# EasyEDA Pro project curtain-lifter.epro, schematic Schematic1
Board Name: Board1; Create Date: 2026-07-17; Page Name: P1; Project Name: 涂鸦智能家居产品-窗帘开关; Schematic Name: Schematic1; Update Date: 2026-07-17; Company: 嘉立创EDA; Page Size: A4; Version: V1.0
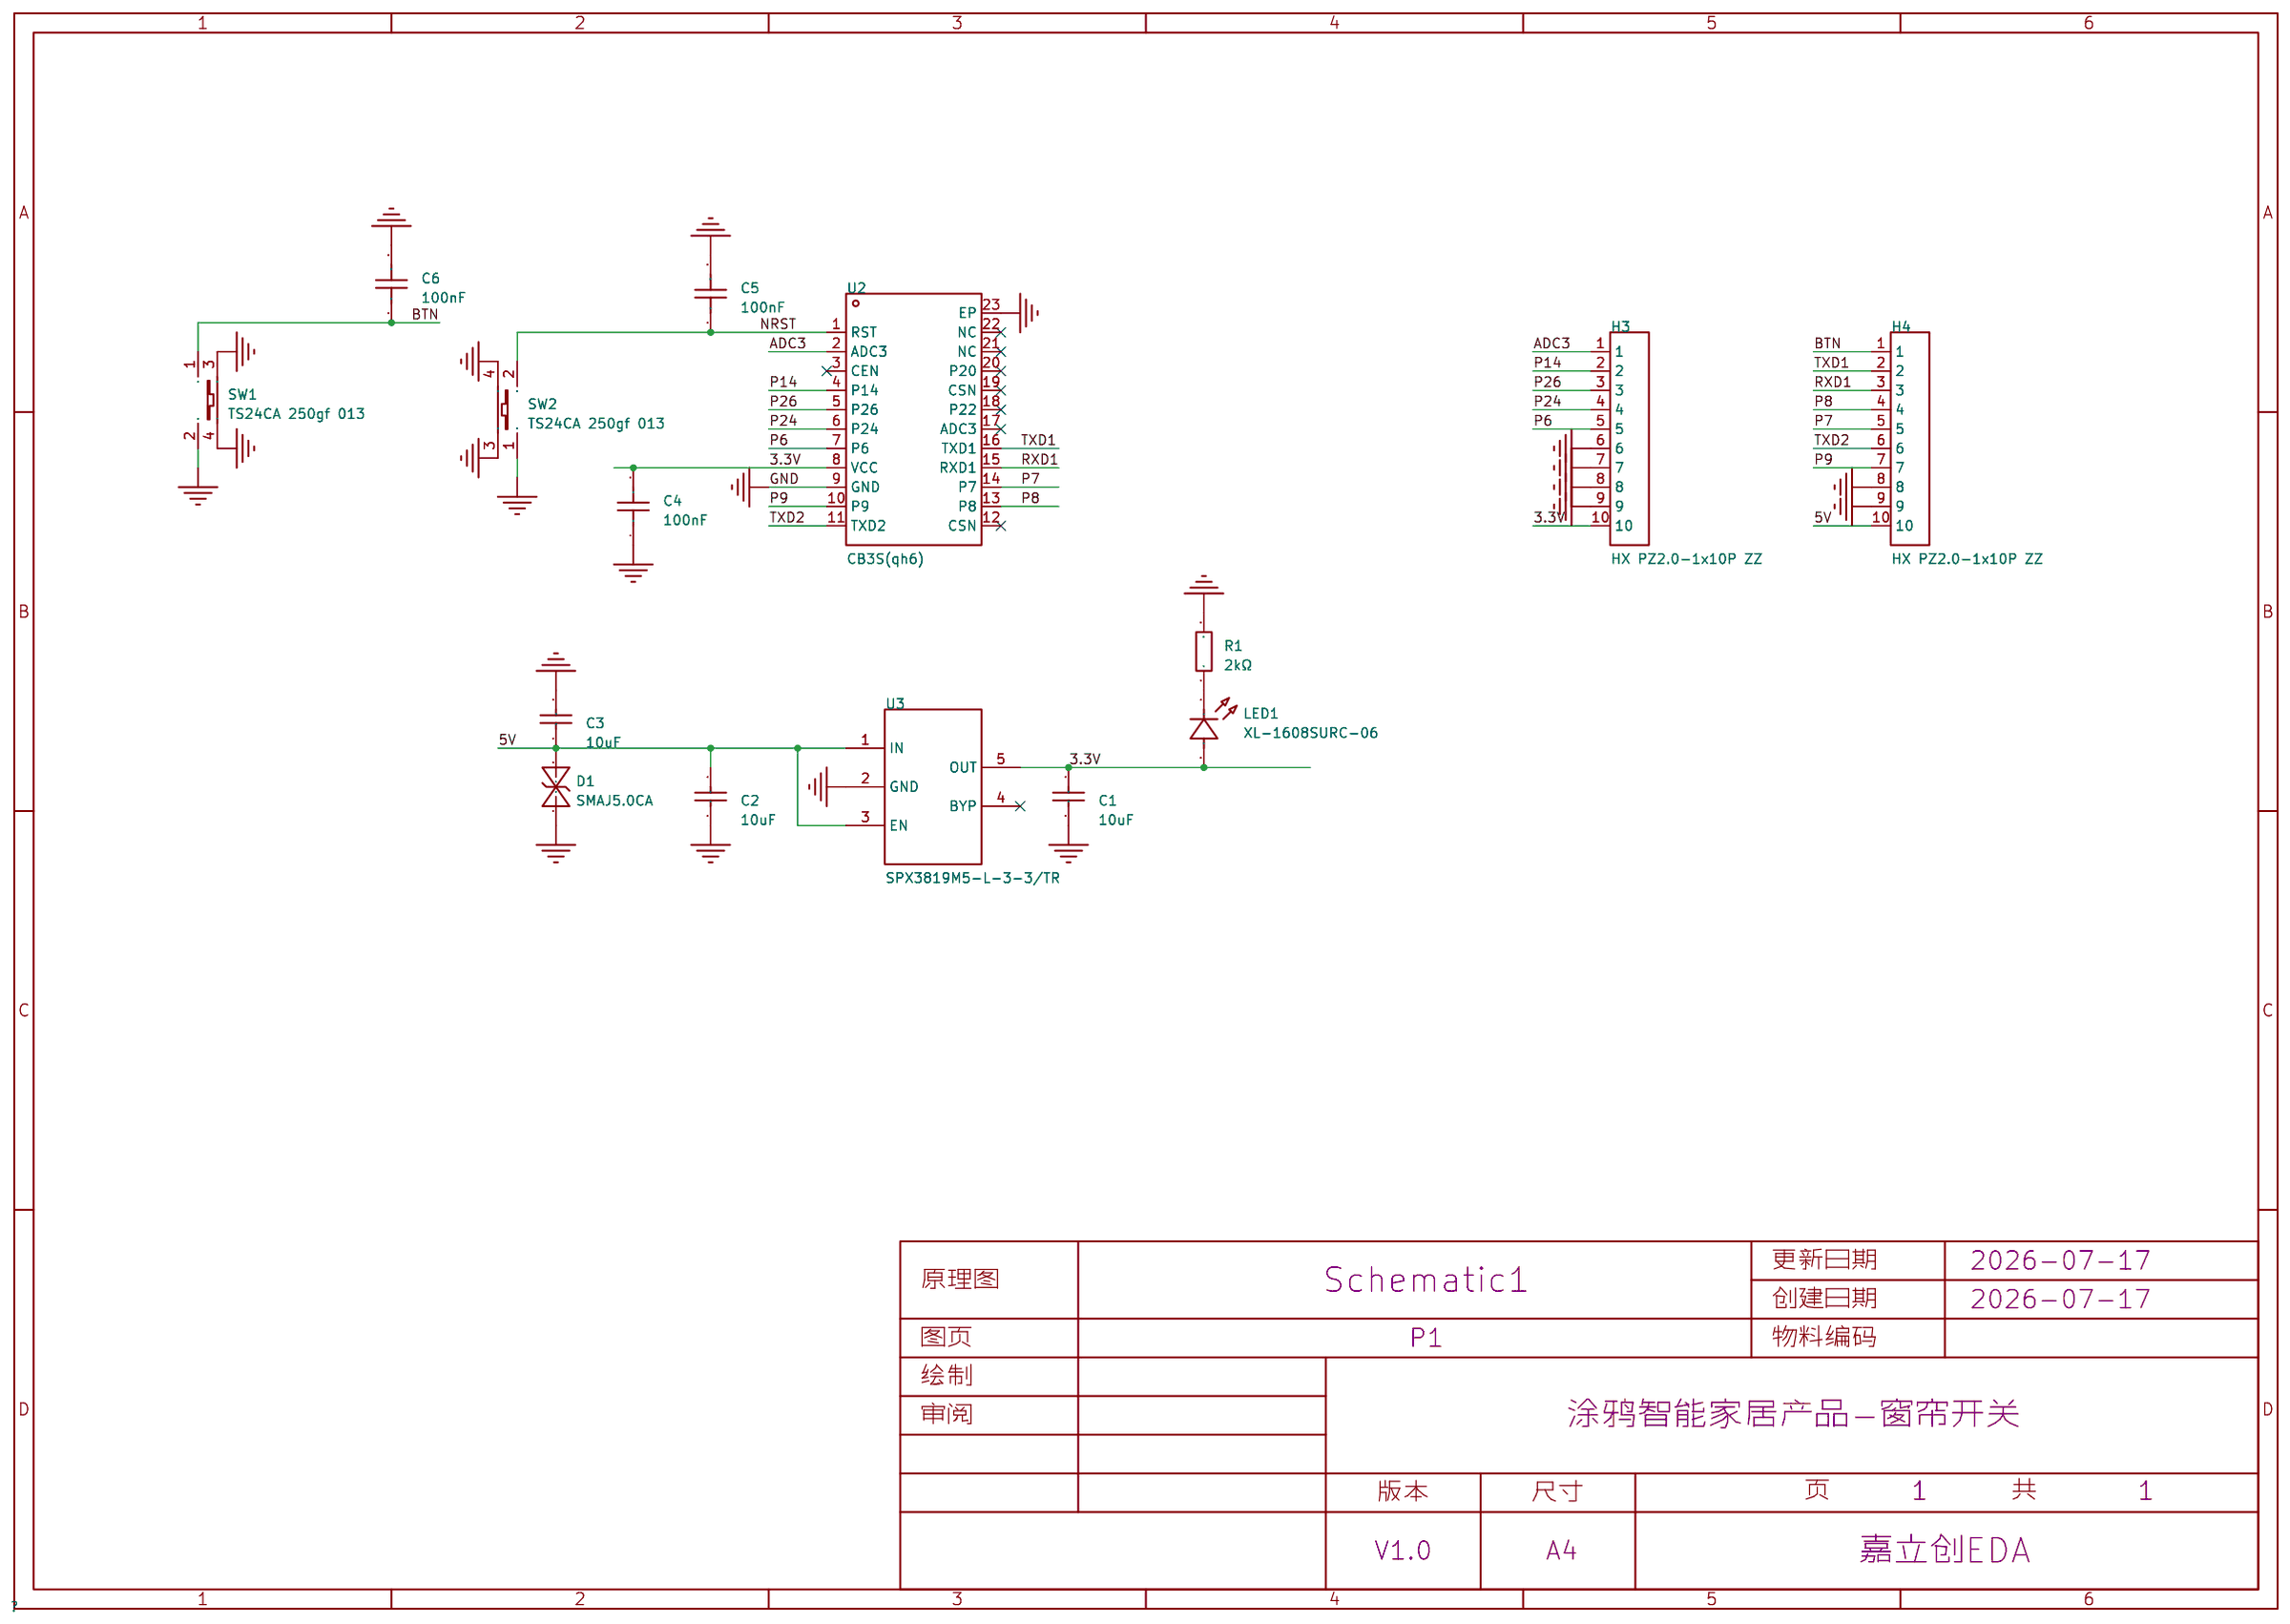
[diagram p5: schematic sheet]

## Parts
C1  10uF  [C0805]
C2  10uF  [C0805]
C3  10uF  [C0805]
C4  100nF  [C0603]
C5  100nF  [C0603]
C6  100nF  [C0603]
D1  SMAJ5.0CA  [SMA_L4.3-W2.6-LS5.0-BI]
H3  HX PZ2.0-1x10P ZZ  [HDR-TH_10P-P2.00-V-M-1]
H4  HX PZ2.0-1x10P ZZ  [HDR-TH_10P-P2.00-V-M-1]
LED1  XL-1608SURC-06  [LED0603-RD_RED]
R1  2kΩ  [R0603]
SW1  TS24CA 250gf 013  [SW-SMD_L4.7-W3.5-P3.35-EH]
SW2  TS24CA 250gf 013  [SW-SMD_L4.7-W3.5-P3.35-EH]
U2  CB3S(qh6)  [WIFIM-SMD_TUYA_CB3S]
U3  SPX3819M5-L-3-3/TR  [SOT-23-5_L3.0-W1.7-P0.95-LS2.8-BL]

## Library data of the parts
C1-C3 = 0805X106K250NT: 容值:10uF;精度:±10%;额定电压:25V;温度系数:X5R;; LCSC Part Name: 10uF ±10% 25V; Supplier Part: C40894; Manufacturer: FH(风华); Supplier Footprint: 0805; JLCPCB Part Class: Extended Part; Datasheet: https://item.szlcsc.com/datasheet/0805X106K250NT/41878.html; Supplier: LCSC; Tolerance: ±10%; Voltage Rating: 25V; Temperature Coefficient: X5R
C4-C6 = CL10B104KB8NNNC: 容值:100nF;精度:±10%;额定电压:50V;温度系数:X7R;; LCSC Part Name: 100nF ±10% 50V; Supplier Part: C1591; Manufacturer: SAMSUNG(三星); Supplier Footprint: 0603; JLCPCB Part Class: Extended Part; Datasheet: https://item.szlcsc.com/datasheet/CL10B104KB8NNNC/1943.html; Supplier: LCSC; Tolerance: ±10%; Voltage Rating: 50V; Temperature Coefficient: X7R
D1 = SMAJ5.0CA_C19077524: 极性:双向;反向截止电压(Vrwm):5V;钳位电压:9.2V;峰值脉冲电流(Ipp):43.5A@10/1000us;峰值脉冲功率(Ppp):400W@10/1000us;击穿电压:7V;; LCSC Part Name: 双向TVS 5V截止 峰值浪涌电流：43.5A@10/1000us; Supplier Part: C19077524; Manufacturer: R+O(宏嘉诚); Supplier Footprint: DO-214AC(SMA); JLCPCB Part Class: Extended Part; Datasheet: https://item.szlcsc.com/datasheet/SMAJ5.0CA/20275609.html; Supplier: LCSC; Polarity: 双向; Reverse Stand-Off Voltage (Vrwm): 5V; Clamping Voltage: 9.2V; Peak Pulse Current (Ipp): 43.5A@10/1000us; Peak Pulse Power Dissipation (Ppp): 400W@10/1000us; Voltage - Breakdown: 7V; Reverse Leakage Current (Ir): 800uA; Number of Channels: 单路; Operating Temperature: -55℃~+150℃; level of protection: IEC 61000-4-2; Type: TVS
H3 H4 = HX PZ2.0-1x10P ZZ: 插针结构:1x10P;间距:2mm;行距:-;圆针/方针:方针;安装方式:直插;排数:单排;总PIN位数:10P;额定电流:1.5A;额定电压:500V;配合针长度:3.9mm;塑高:2mm;端接针长度:2.8mm;触头材质:黄铜;触头镀层:金;工作温度:-40℃~+105℃;颜色:黑色;; LCSC Part Name: 1x10P 间距:2mm 方针 直插; Supplier Part: C22438293; Manufacturer: hanxia(韩下); Supplier Footprint: 插件,P=2mm; JLCPCB Part Class: Extended Part; Datasheet: https://item.szlcsc.com/datasheet/HX%2520PZ2.0-1x10P%2520ZZ/24075388.html; Supplier: LCSC; Pin Structure: 1x10P; Pitch: 2mm; Circluar Pins/Square Pins: 方针; Mounting Type: 直插; Number of Rows: 单排; Number of Pins: 10P; Current Rating: 1.5A; Voltage Rating (Max): 500V; Length of Mating Pin: 3.9mm; Insulation Height: 2mm; Length of End Connection Pin: 2.8mm; Contact Material: 黄铜; Contact Plating: 金; Operating Temperature: -40℃~+105℃; Color: 黑色
LED1 = XL-1608SURC-06: 灯头类型:1.6mmx0.8mm方形灯头;发光颜色:红色;正向压降(Vf):2.3V;功率:50mW;正向电流:20mA;波长:620nm~630nm;二极管配置:独立二极管;透镜颜色:无色透明透镜;色温:-;发光强度:225mcd;发光角度:120°;载带方式:正贴;工作温度:-40℃~+85℃;; LCSC Part Name: 0603红色贴片式发光二极管; Supplier Part: C965799; Manufacturer: XINGLIGHT(成兴光); Supplier Footprint: 0603; JLCPCB Part Class: Extended Part; Datasheet: https://item.szlcsc.com/datasheet/XL-1608SURC-06/1051408.html; Supplier: LCSC; Lamp Holder Type: 1.6mmx0.8mm方形灯头; Illumination Color: 红色; Voltage - Forward(Vf): 2.3V; Power(Watts): 50mW; Forward Current: 20mA; Wavelength - Dominant: 620nm~630nm; Peak Wavelength: 625nm; Diode Configuration: 独立二极管; Lens Color: 无色透明透镜; Luminous Intensity: 225mcd; Viewing Angle: 120°; Mounting Style: 正贴; Operating Temperature: -40℃~+85℃
R1 = RS-03K202JT: 电阻类型:厚膜电阻;阻值:2kΩ;精度:±5%;功率:100mW;工作电压:50V;温度系数:±100ppm/℃;; LCSC Part Name: 厚膜电阻 2kΩ ±5% 100mW; Supplier Part: C72817; Manufacturer: FH(风华); Supplier Footprint: 0603; JLCPCB Part Class: Extended Part; Datasheet: https://item.szlcsc.com/datasheet/RS-03K202JT/73929.html; Supplier: LCSC; Type: 厚膜电阻; Tolerance: ±5%; Power(Watts): 100mW; Voltage-Supply(Max): 50V; Temperature Coefficient: ±100ppm/℃; Operating Temperature: -55℃~+155℃
SW1 SW2 = TS24CA 250gf 013: 电路结构:单刀单掷;按钮形状:矩形按钮;作用力:2.5N;安装方式:卧贴;开关长度:4.7mm;开关宽度:1.9mm;开关高度:3.5mm;带支架:不带支架;触点电流:50mA;额定电压:12V;带灯:无;工作寿命:3万次;; LCSC Part Name: 4.55*1.8*3.5mm 卧贴 轻触开关; Supplier Part: C5373430; Manufacturer: SHOU HAN(首韩); Supplier Footprint: SMD; JLCPCB Part Class: Extended Part; Datasheet: https://item.szlcsc.com/datasheet/TS24CA%2520250gf%2520013/6227347.html; Supplier: LCSC; Circuit: 单刀单掷; Actuator Style: 矩形按钮; Operating Force: 2.5N; Mounting Type: 卧贴; Length: 4.7mm; Width: 1.9mm; Switch Height: 3.5mm; with Bracket: 不带支架; Contact Current: 50mA; Voltage Rating: 12V; Actuator/Cap Color: 黑色; With Lamp: 无; Termination Style: SMD接片; Life: 3万次; Operating Temperature: -25℃~+70℃
U2 = CB3S(qh6): 万能遥控器模组/蓝牙模块/WiFi模块 24x16x2.8mm; Supplier Part: C2844245; Manufacturer: TUYA(涂鸦）; Supplier Footprint: SMD; JLCPCB Part Class: Extended Part; Datasheet: https://atta.szlcsc.com/upload/public/pdf/source/20210715/C2844243_DE56EB21321E60DA61991EF75D0C6038.pdf; Supplier: LCSC
U3 = SPX3819M5-L-3-3/TR: 输出极性:正极;工作电压:16V;输出电压:3.3V;输出电流:500mA;电源纹波抑制比(PSRR):70dB;输出类型:固定;; LCSC Part Name: 3.3V 500mA 16V; Supplier Part: C9055; Manufacturer: MaxLinear(迈凌); Supplier Footprint: SOT-23-5; JLCPCB Part Class: Extended Part; Datasheet: https://item.szlcsc.com/datasheet/SPX3819M5-L-3-3%252FTR/9575.html; Supplier: LCSC; Output Configuration: 正极; Voltage - Supply: 16V; Output Voltage: 3.3V; Output Current: 500mA; Power Supply Rejection Ratio (PSRR): 70dB; Voltage Dropout: 340mV@(500mA); standby current: 90uA; Noise: 40uVrms; Features: 过流保护；反极性电压保护；使能控制；噪声旁路端子；热关断; Operating Temperature: -40℃~+125℃; Output Type: 固定; Number of Outputs: 1

## Nets
3.3V: C1.2 C4.2 H3.10 LED1.2(A) U2.8(VCC) U3.5(OUT)
5V: C2.2 C3.1 D1.2 H4.10 U3.1(IN) U3.3(EN)
GND: C1.1 C2.1 C3.2 C4.1 C5.2 C6.2 D1.1 H3.6 H3.7 H3.8 H3.9 H4.8 H4.9 R1.2 SW1.2 SW1.3 SW1.4 SW2.1 SW2.3 SW2.4 U2.9(GND) U2.23(EP) U3.2(GND)
ADC3: H3.1 U2.2(ADC3)
BTN: C6.1 H4.1 SW1.1
NRST: C5.1 SW2.2 U2.1(RST)
P6: H3.5 U2.7(P6)
P7: H4.5 U2.14(P7)
P8: H4.4 U2.13(P8)
P9: H4.7 U2.10(P9)
P14: H3.2 U2.4(P14)
P24: H3.4 U2.6(P24)
P26: H3.3 U2.5(P26)
RXD1: H4.3 U2.15(RXD1)
TXD1: H4.2 U2.16(TXD1)
TXD2: H4.6 U2.11(TXD2)
$1N62: LED1.1(K) R1.1

Not connected (* = marked no-connect by the designer): U2 3(CEN)* 12(CSN)* 17(ADC3)* 18(P22)* 19(CSN)* 20(P20)* 21(NC)* 22(NC)*; U3 4(BYP)*
